# Altium schematic sheet type_C_A_power.SchDoc
size B; SheetNumber: 3; SheetTotal: 7
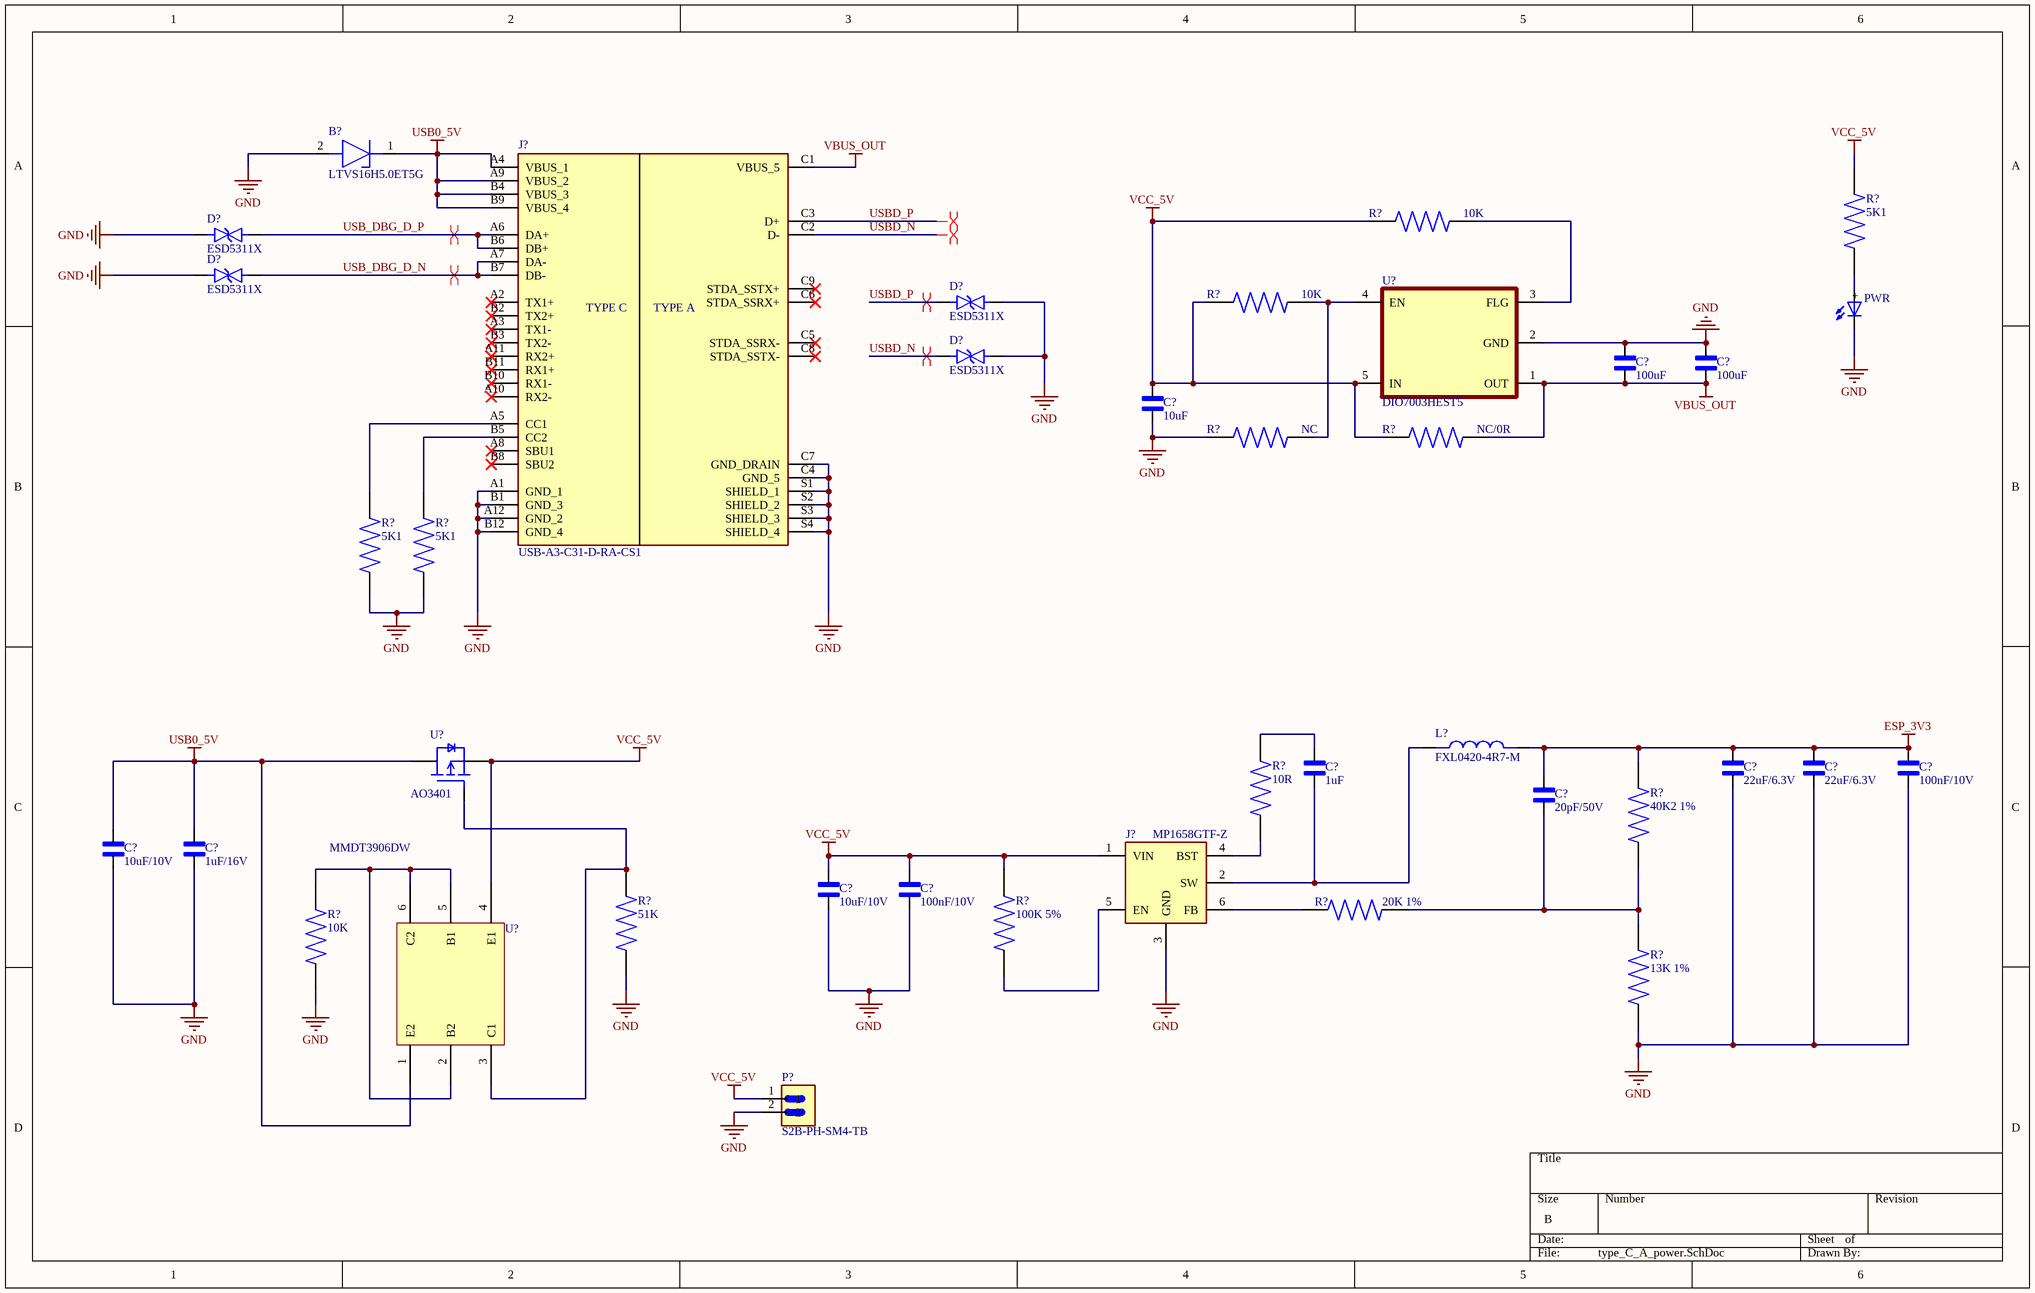
[diagram p0: type_C_A_power.SchDoc]

## Parts
(Parts that share a designator on the sheet are numbered #1, #2 ... from top to bottom, then left to right.)
B?  LTVS16H5.0ET5G  [LTVS16H50ET5G]
C?#1  100uF  [CAPC1005X61N]
C?#2  100uF  [CAPC1005X61N]
C?#3  10uF  [CAPC1005X61N]
C?#4  1uF  [CAPC1005X61N]
C?#5  22uF/6.3V  [CAPC1005X61N]
C?#6  22uF/6.3V  [CAPC1005X61N]
C?#7  100nF/10V  [CAPC1005X61N]
C?#8  20pF/50V  [CAPC1005X61N]
C?#9  10uF/10V  [CAPC1005X61N]
C?#10  1uF/16V  [CAPC1005X61N]
C?#11  10uF/10V  [CAPC1005X61N]
C?#12  100nF/10V  [CAPC1005X61N]
D?#1  ESD5311X  [DIO_PZU13B2L,315]
D?#2  ESD5311X  [DIO_PZU13B2L,315]
D?#3  ESD5311X  [DIO_PZU13B2L,315]
D?#4  ESD5311X  [DIO_PZU13B2L,315]
J?#1  USB-A3-C31-D-RA-CS1  [USBA3C31DRACS1]
J?#2  MP1658GTF-Z  [SOTFL50P160X60-6N]
L?  FXL0420-4R7-M  [FXL0420-XRX-M]
P?  S2B-PH-SM4-TB  [JST_S2B-PH-SM4-TB]
PWR  WL-SMCW_1206  [WL-SMCW_1206]  (value not drawn)
R?#1  10K  [RES_ERJU02F5102X]
R?#2  5K1  [RES_ERJU02F5102X]
R?#3  10K  [RES_ERJU02F5102X]
R?#4  NC  [RES_ERJU02F5102X]
R?#5  NC/0R  [RES_ERJU02F5102X]
R?#6  5K1  [RES_ERJU02F5102X]
R?#7  5K1  [RES_ERJU02F5102X]
R?#8  10R  [RES_ERJU02F5102X]
R?#9  40K2 1%  [RES_ERJU02F5102X]
R?#10  20K 1%  [RES_ERJU02F5102X]
R?#11  51K  [RES_ERJU02F5102X]
R?#12  100K 5%  [RES_ERJU02F5102X]
R?#13  10K  [RES_ERJU02F5102X]
R?#14  13K 1%  [RES_ERJU02F5102X]
U?#1  DIO7003HEST5  [SOT95P280X145-5N]
U?#2  AO3401  [SOT23-3]
U?#3  MMDT3906DW  [SOT65P230X120-6N]

## Nets
ESP_3V3: C?#5.2 C?#6.2 C?#7.2 C?#8.2 L?.2 R?#9.1
GND: B?.2(A) C?#1.2 C?#2.2 C?#3.1 C?#5.1 C?#6.1 C?#7.1 C?#9.1 C?#10.1 C?#11.1 C?#12.1 D?#1.1(K) D?#2.1(K) D?#3.2(A) D?#4.2(A) J?#1.A1(GND_1) J?#1.A12(GND_2) J?#1.B1(GND_3) J?#1.B12(GND_4) J?#1.C4(GND_5) J?#1.C7(GND_DRAIN) J?#1.S1(SHIELD_1) J?#1.S2(SHIELD_2) J?#1.S3(SHIELD_3) J?#1.S4(SHIELD_4) J?#2.3(GND) P?.2 PWR.1(NEG) R?#4.1 R?#6.1 R?#7.1 R?#11.1 R?#13.1 R?#14.2 U?#1.2(GND)
USB0_5V: B?.1(K) C?#9.2 C?#10.2 J?#1.A4(VBUS_1) J?#1.A9(VBUS_2) J?#1.B4(VBUS_3) J?#1.B9(VBUS_4) U?#2.3(D) U?#3.1(E2)
VBUS_OUT: C?#1.1 C?#2.1 J?#1.C1(VBUS_5) R?#5.2 U?#1.1(OUT)
VCC_5V: C?#3.2 C?#11.2 C?#12.2 J?#2.1(VIN) P?.1 R?#1.1 R?#2.2 R?#3.1 R?#5.1 R?#12.2 U?#1.5(IN) U?#2.2(S) U?#3.4(E1)
USB_DBG_D_N: D?#2.2(A) J?#1.A7(DA-) J?#1.B7(DB-)
USB_DBG_D_P: D?#1.2(A) J?#1.A6(DA+) J?#1.B6(DB+)
USBD_N: D?#4.1(K) J?#1.C2(D-)
USBD_P: D?#3.1(K) J?#1.C3(D+)
NetC?#4_1: C?#4.1 J?#2.2(SW) L?.1
NetC?#4_2: C?#4.2 R?#8.2
NetC?#8_1: C?#8.1 R?#9.2 R?#10.1 R?#14.1
NetJ?#1_A5: J?#1.A5(CC1) R?#6.2
NetJ?#1_B5: J?#1.B5(CC2) R?#7.2
NetJ?#2_4: J?#2.4(BST) R?#8.1
NetJ?#2_5: J?#2.5(EN) R?#12.1
NetJ?#2_6: J?#2.6(FB) R?#10.2
NetPWR_2: PWR.2(POS) R?#2.1
NetR?#1_2: R?#1.2 U?#1.3(FLG)
NetR?#3_2: R?#3.2 R?#4.2 U?#1.4(EN)
NetR?#11_2: R?#11.2 U?#2.1(G) U?#3.3(C1)
NetR?#13_2: R?#13.2 U?#3.2(B2) U?#3.5(B1) U?#3.6(C2)

Not connected (* = marked no-connect by the designer): J?#1 A2(TX1+)* A3(TX1-)* A8(SBU1)* A10(RX2-)* A11(RX2+)* B2(TX2+)* B3(TX2-)* B8(SBU2)* B10(RX1-)* B11(RX1+)* C5(STDA_SSRX-)* C6(STDA_SSRX+)* C8(STDA_SSTX-)* C9(STDA_SSTX+)*

## Layout directives
differential pair: USB_DBG_D_N, USB_DBG_D_P, USBD_N, USBD_P

## Notes on the sheet
- (in symbol USB-A3-C31-D-RA-CS1) TYPE C; TYPE A
- (in symbol WL-SMCW_1206) +

## Library data of the parts
B? = LTVS16H5.0ET5G: DFN1610 ESD Protection Devices ROHS; Manufacturer_Name: LRC; Geometry.Height: 0.55mm; Manufacturer_Part_Number: LTVS16H5.0ET5G; Mouser Part Number: *; Mouser Price/Stock: *; Arrow Part Number: *; Arrow Price/Stock: *; Datasheet Link: https://www.alldatasheet.net/datasheet-pdf/pdf/1107931/LRC/LTVS16H5.0ET5G.html
C?#1-C?#12 = cap_0402_VJ0402D100MXCAP: cap 0402; MF: Vishay Vitramon; SnapEDA_Link: https://www.snapeda.com/parts/VJ0402D100MXCAP/Vishay/view-part/?ref=snap; Package: 1005 Vishay Vitramon; Value: *; MP: VJ0402D100MXCAP; Check_prices: https://www.snapeda.com/parts/VJ0402D100MXCAP/Vishay/view-part/?ref=eda
D?#1-D?#4 = ESD5311X: Bidirectional TVS ESD Protection Diode, 5V Working Voltage, Low Capacitance, 80W Peak Pulse Power, DFN1006-2 Package.; MF: Nexperia; MP: PZU13B2L,315; SnapEDA_Link: https://www.snapeda.com/parts/PZU13B2L,315/Nexperia/view-part/?ref=snap; Package: DFN1006-2-2 Nexperia USA Inc.; Value: *; Check_prices: https://www.snapeda.com/parts/PZU13B2L,315/Nexperia/view-part/?ref=eda
J?#1 = USB-A3-C31-D-RA-CS1: Connector, USB TYPE-A 3.0 over TYPE-C 3.1, right angle, PCB, terminals; Manufacturer_Name: Adam Tech; Geometry.Height: 15.91mm; Manufacturer_Part_Number: USB-A3-C31-D-RA-CS1; Mouser Part Number: 737-USBA3C31DRACS1; Mouser Price/Stock: https://www.mouser.co.uk/ProductDetail/Adam-Tech/USB-A3-C31-D-RA-CS1?qs=HoCaDK9Nz5e7qYzkfwPXcA%3D%3D; Arrow Part Number: USB-A3-C31-D-RA-CS1; Arrow Price/Stock: https://www.arrow.com/en/products/usb-a3-c31-d-ra-cs1/adam-tech.html?utm_currency=USD&region=nac; Datasheet Link: https://app.adam-tech.com/products/download/data_sheet/195873/usb-a3-c31-d-ra-cs1-data-sheet.pdf
J?#2 = MP1658GTF-Z: MF: MPS Industries, Inc.; SnapEDA_Link: https://www.snapeda.com/parts/MP1658GTF-Z/MPS/view-part/?ref=snap; Package: None; Value: *; MP: MP1658GTF-Z; Check_prices: https://www.snapeda.com/parts/MP1658GTF-Z/MPS/view-part/?ref=eda
L? = FXL0420-XRX-M: 47uH 4.4x4.2x2 2.8A
P? = S2B-PH-SM4-TB: Connector Header Surface Mount, Right Angle 2 position 0.079 (2.00mm); MF: JST Sales; SnapEDA_Link: https://www.snapeda.com/parts/S2B-PH-SM4-TB/JST/view-part/?ref=snap; Package: None; Value: *; MP: S2B-PH-SM4-TB; Check_prices: https://www.snapeda.com/parts/S2B-PH-SM4-TB/JST/view-part/?ref=eda
PWR = WL-SMCW_1206: 1206, Blue Typ.(@20mA): 470nm, 145mcd, 3.2V, 140Â° InGaN; MF: Wurth Electronics; MP: 150120BS75000; SnapEDA_Link: https://www.snapeda.com/parts/150120BS75000/Wurth+Electronics/view-part/?ref=snap; Package: 1206 Wurth Electronics; Value: *; Check_prices: https://www.snapeda.com/parts/150120BS75000/Wurth+Electronics/view-part/?ref=eda
R?#1-R?#14 = res_0402_ERJU02F5102X: Availability: Unavailable; MP: ERJU02F5102X; Price: None; Package: None; Value: *
U?#1 = DIO7003HEST5: Low-loss 5.5V power distribution switch with 2A continuous output current, 2.5A current limit, active-high enable, overcurrent protection, short-circuit protection, thermal protection, reverse-current blocking, and undervoltage lockout. Package: SOT-23-5.; MF: Texas Instruments; MP: SN74LVC1G08DBVTE4; SnapEDA_Link: https://www.snapeda.com/parts/SN74LVC1G08DBVTE4/Texas+Instruments/view-part/?ref=snap; Package: SOT-23-5 Texas Instruments; Value: *; Check_prices: https://www.snapeda.com/parts/SN74LVC1G08DBVTE4/Texas+Instruments/view-part/?ref=eda
U?#2 = AO3401: P-Channel 30 V 4A (Ta) 1.4W (Ta) Surface Mount SOT-23-3; MF: Alpha & Omega Semiconductor; SnapEDA_Link: https://www.snapeda.com/parts/AO3401/Alpha/view-part/?ref=snap; Package: SOT-23-3 Alpha &amp; Omega Semiconductor; Value: *; MP: AO3401; Check_prices: https://www.snapeda.com/parts/AO3401/Alpha/view-part/?ref=eda
U?#3 = MMDT3906DW: Bipolar (BJT) Transistor PNP 40 V 0.2 A 250MHz 200 mW Surface Mount SOT-363